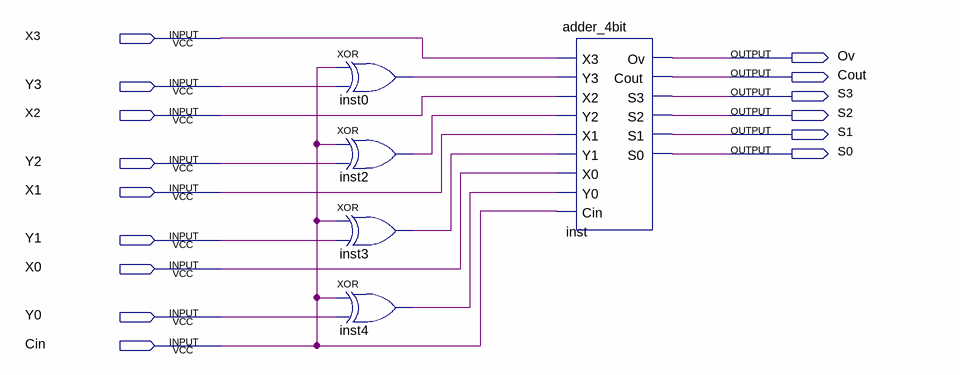
[diagram p0: schematic sheet]
// Quartus schematic adder_sub.bdf as structural Verilog: 5 symbols, 15 pins
module adder_sub (
  input  X3,
  input  Y3,
  input  X2,
  input  Y2,
  input  X1,
  input  Y1,
  input  X0,
  input  Y0,
  input  Cin,
  output Ov,
  output Cout,
  output S3,
  output S2,
  output S1,
  output S0
);

  wire inst0_out, inst2_out, inst3_out, inst4_out;

  xor inst0 (inst0_out, Cin, Y3);
  xor inst2 (inst2_out, Cin, Y2);
  xor inst3 (inst3_out, Cin, Y1);
  xor inst4 (inst4_out, Cin, Y0);
  adder_4bit inst (
    .X3(X3), .Y3(inst0_out), .X2(X2), .Y2(inst2_out), .X1(X1), .Y1(inst3_out), .X0(X0), .Y0(inst4_out),
    .Cin(Cin), .Ov(Ov), .Cout(Cout), .S3(S3), .S2(S2), .S1(S1), .S0(S0));
endmodule
